# Altium schematic sheet Meteo.SchDoc..schdoc
size 199 x 164 mm; SheetNumber: 1; SheetTotal: 1
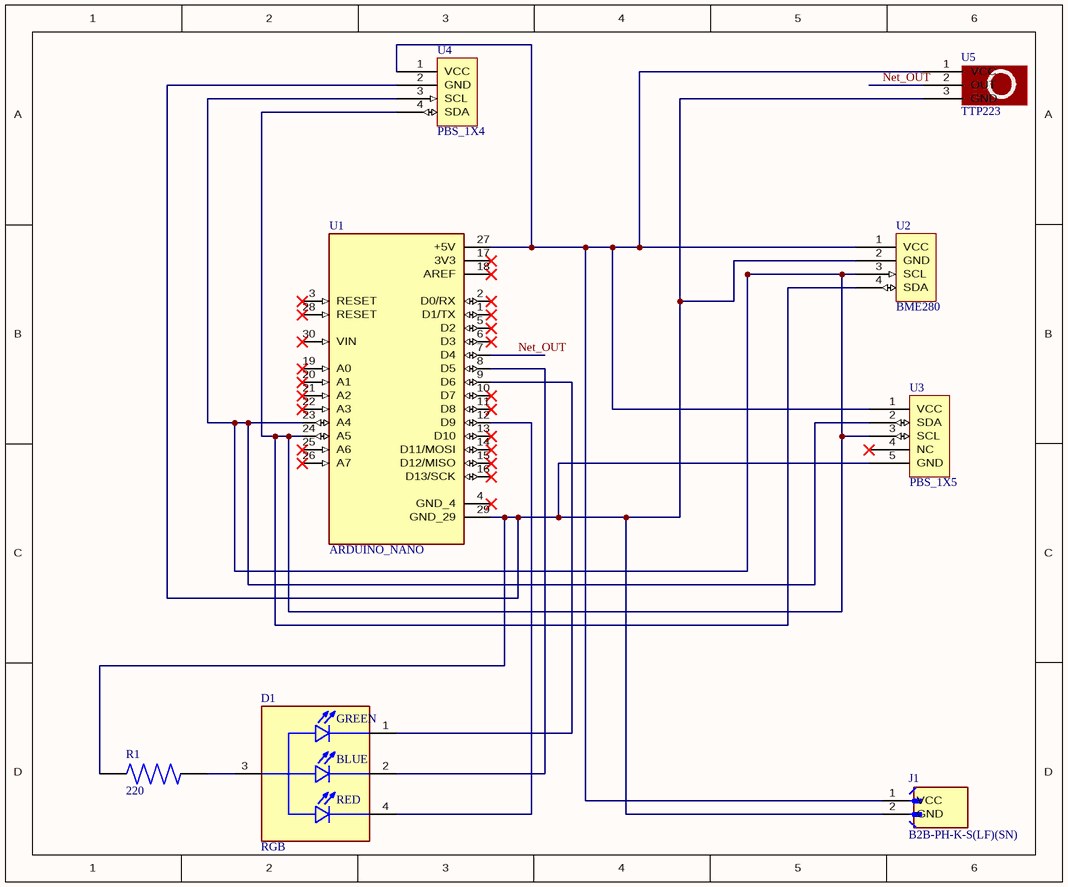
[diagram p0: Meteo.SchDoc..schdoc]

## Parts
D1  RGB  [RGB]
J1  B2B-PH-K-S(LF)(SN)  [JST_B2B-PH-K-S(LF)(SN)]
R1  220  [RES]
U1  ARDUINO_NANO  [MODULE_ARDUINO_NANO]
U2  BME280  [PBS_1X4_P2.54]
U3  PBS_1X5  [PBS_1X5_P2.54]
U4  PBS_1X4  [PBS_1X4_P2.54]
U5  TTP223  [TTP223]

## Nets
Net_OUT: U1.7(D4) U5.2(OUT)
NetD1_1: D1.1(CATHODE_GREEN) U1.9(D6)
NetD1_2: D1.2(CATHODE_BLUE) U1.8(D5)
NetD1_3: D1.3(COMMON_ANODE) R1.2
NetD1_4: D1.4(CATHODE_RED) U1.12(D9)
NetJ1_1: J1.1(VCC) U1.27(+5V) U2.1(VCC) U3.1(VCC) U4.1(VCC) U5.1(VCC)
NetJ1_2: J1.2(GND) R1.1 U1.29(GND_29) U2.2(GND) U3.5(GND) U4.2(GND) U5.3(GND)
NetU1_23: U1.23(A4) U1.24(A5) U2.3(SCL) U2.4(SDA) U3.2(SDA) U3.3(SCL) U4.3(SCL) U4.4(SDA)

Not connected (* = marked no-connect by the designer): U1 1(D1/TX)* 2(D0/RX)* 3(RESET)* 4(GND_4)* 5(D2)* 6(D3)* 10(D7)* 11(D8)* 13(D10)* 14(D11/MOSI)* 15(D12/MISO)* 16(D13/SCK)* 17(3V3)* 18(AREF)* 19(A0)* 20(A1)* 21(A2)* 22(A3)* 25(A6)* 26(A7)* 28(RESET)* 30(VIN)*; U3 4(NC)*

## Notes on the sheet
- (in symbol RGB) GREEN; BLUE; RED

## Library data of the parts
D1 = RGB: MF: QT Brightek (QTB); MP: QBL8RGB60D0-2897; SnapEDA_Link: https://www.snapeda.com/parts/QBL8RGB60D0-2897/QT/view-part/?ref=snap; Package: Radial QT Brightek (QTB); Value: *; Check_prices: https://www.snapeda.com/parts/QBL8RGB60D0-2897/QT/view-part/?ref=eda
J1 = B2B-PH-K-S(LF)(SN): Connector Header Through Hole 2 position 0.079 (2.00mm); MF: JST; SnapEDA_Link: https://www.snapeda.com/parts/B2B-PH-K-S%20(LF)(SN)/JST/view-part/?ref=snap; Package: None; Value: *; MP: B2B-PH-K-S (LF)(SN); Check_prices: https://www.snapeda.com/parts/B2B-PH-K-S%20(LF)(SN)/JST/view-part/?ref=eda
R1 = RES: MF: Yageo; MP: MFR-25FBF52-1K; SnapEDA_Link: https://www.snapeda.com/parts/MFR-25FBF52-1K/Yageo/view-part/?ref=snap; Package: RADIAL-2 YAGEO; Value: *; Check_prices: https://www.snapeda.com/parts/MFR-25FBF52-1K/Yageo/view-part/?ref=eda
U1 = ARDUINO_NANO: Small, complete, and breadboard-friendly board based on the ATmega328 (Arduino Nano 3.x); SnapEDA_Link: https://www.snapeda.com/parts/Arduino%20Nano/Arduino/view-part/?ref=snap; Package: Non-Standard Arduino; Value: *; MF: Arduino; MP: Arduino Nano; Check_prices: https://www.snapeda.com/parts/Arduino%20Nano/Arduino/view-part/?ref=eda
U2 = PBS_1X4